# Altium schematic sheet STM32C0_ST25R100_EVK.SchDoc
size A; SheetNumber: 1; SheetTotal: 4
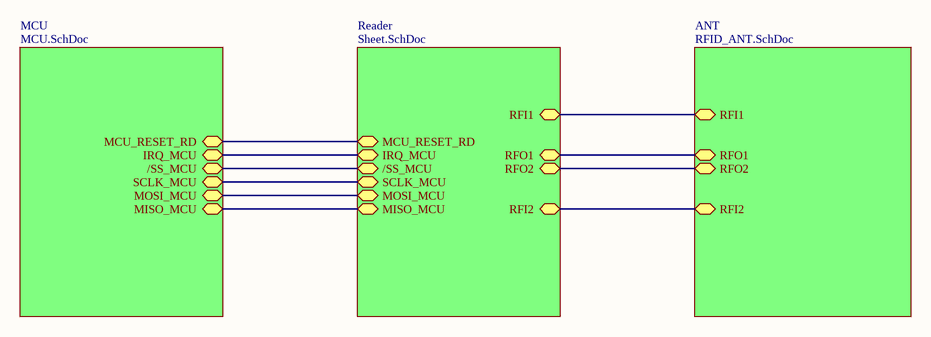
[diagram p0: STM32C0_ST25R100_EVK.SchDoc]

## Sub-sheets
ANT = RFID_ANT.SchDoc: RFI1 (bidir), RFI2 (bidir), RFO1 (bidir), RFO2 (bidir)
MCU = MCU.SchDoc: /SS_MCU (bidir), MOSI_MCU (bidir), SCLK_MCU (bidir), IRQ_MCU (bidir), MISO_MCU (bidir), MCU_RESET_RD (bidir)
Reader = Sheet.SchDoc: /SS_MCU (bidir), MOSI_MCU (bidir), SCLK_MCU (bidir), IRQ_MCU (bidir), MISO_MCU (bidir), MCU_RESET_RD (bidir), RFI1 (bidir), RFI2 (bidir), RFO1 (bidir), RFO2 (bidir)

## Nets
(unnamed): sheet MCU//SS_MCU, sheet Reader//SS_MCU
(unnamed): sheet MCU/MOSI_MCU, sheet Reader/MOSI_MCU
(unnamed): sheet MCU/SCLK_MCU, sheet Reader/SCLK_MCU
(unnamed): sheet MCU/IRQ_MCU, sheet Reader/IRQ_MCU
(unnamed): sheet MCU/MISO_MCU, sheet Reader/MISO_MCU
(unnamed): sheet MCU/MCU_RESET_RD, sheet Reader/MCU_RESET_RD
(unnamed): sheet Reader/RFI1, sheet ANT/RFI1
(unnamed): sheet Reader/RFI2, sheet ANT/RFI2
(unnamed): sheet Reader/RFO1, sheet ANT/RFO1
(unnamed): sheet Reader/RFO2, sheet ANT/RFO2